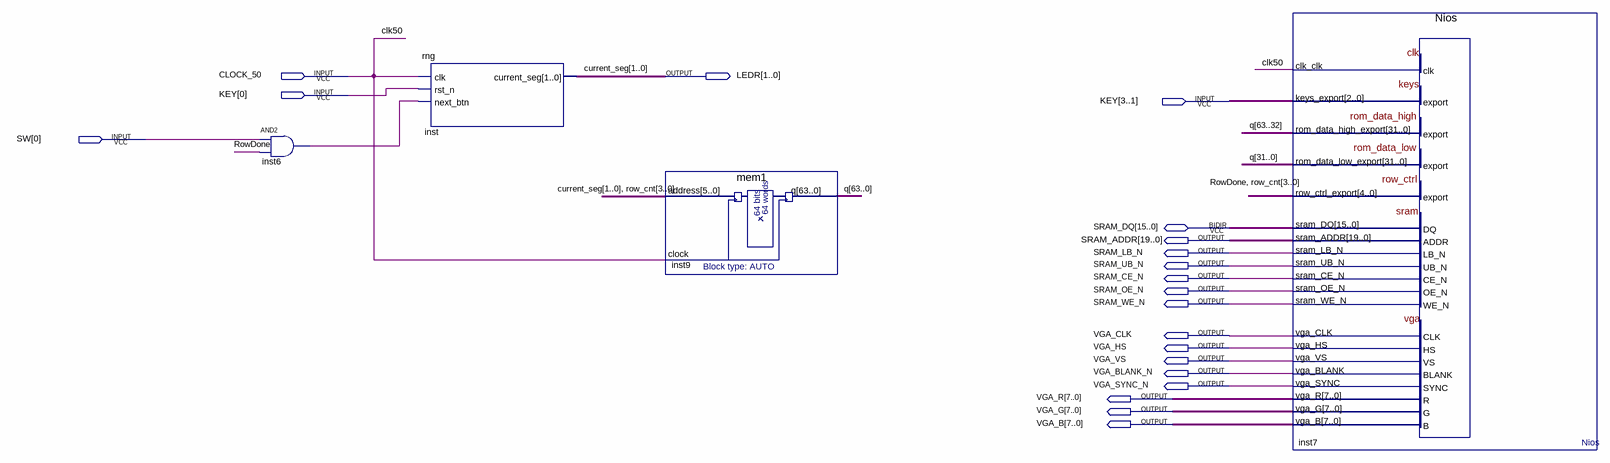
[diagram p0: schematic sheet]
// Quartus schematic RetroRacingGame.bdf as structural Verilog: 4 symbols, 20 pins
module RetroRacingGame (
  input  CLOCK_50,
  input  [3:0] KEY,
  input  [0:0] SW,
  inout  [15:0] SRAM_DQ,
  output [1:0] LEDR,
  output [19:0] SRAM_ADDR,
  output SRAM_LB_N,
  output SRAM_UB_N,
  output SRAM_CE_N,
  output SRAM_OE_N,
  output SRAM_WE_N,
  output VGA_CLK,
  output VGA_HS,
  output VGA_VS,
  output VGA_BLANK_N,
  output VGA_SYNC_N,
  output [7:0] VGA_R,
  output [7:0] VGA_G,
  output [7:0] VGA_B
);

  wire inst6_out, RowDone;
  wire [3:0] row_cnt;
  wire [63:0] q;

  and inst6 (inst6_out, SW[0], RowDone);
  rng inst (.clk(CLOCK_50), .rst_n(KEY[0]), .next_btn(inst6_out), .current_seg(LEDR));
  mem1 inst9 (.address({LEDR, row_cnt}), .clock(CLOCK_50), .q(q));
  Nios inst7 (
    .clk_clk(CLOCK_50), .keys_export(KEY[3:1]), .rom_data_high_export(q[63:32]),
    .rom_data_low_export(q[31:0]), .row_ctrl_export({RowDone, row_cnt}), .sram_ADDR(SRAM_ADDR),
    .sram_LB_N(SRAM_LB_N), .sram_UB_N(SRAM_UB_N), .sram_CE_N(SRAM_CE_N), .sram_OE_N(SRAM_OE_N),
    .sram_WE_N(SRAM_WE_N), .vga_CLK(VGA_CLK), .vga_HS(VGA_HS), .vga_VS(VGA_VS), .vga_BLANK(VGA_BLANK_N),
    .vga_SYNC(VGA_SYNC_N), .vga_R(VGA_R), .vga_G(VGA_G), .vga_B(VGA_B), .sram_DQ(SRAM_DQ));

  // Other names for the same wires on the sheet: clk50 = CLOCK_50; current_seg[1:0] = LEDR
endmodule
